# EAGLE design source_eagle (EAGLE 6.5.0)
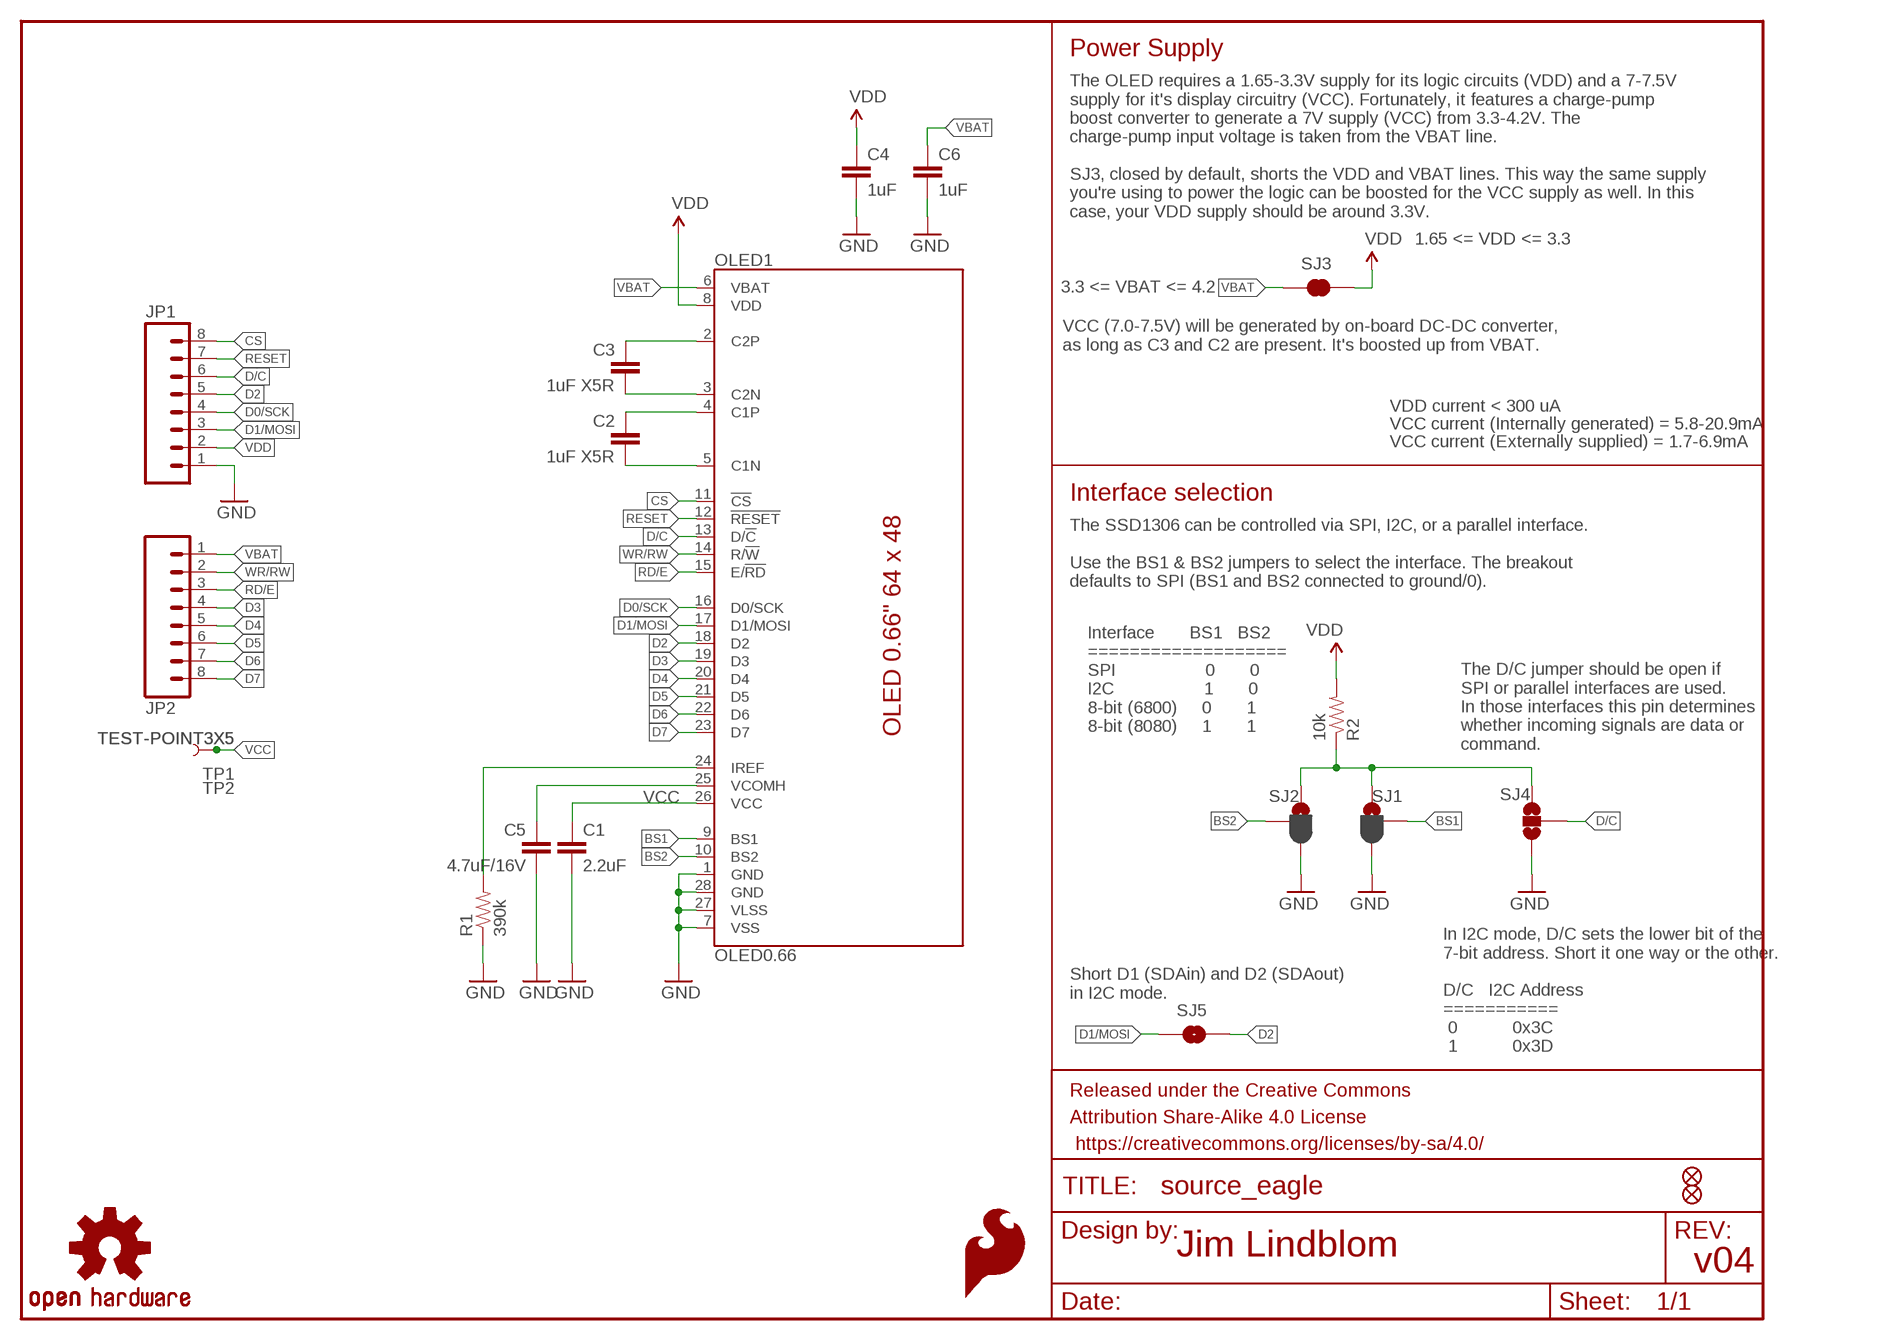
[diagram p0: schematic, sheet 1]

## Parts
C1  2.2uF  CAP0805  [0805]
C2  1uF X5R  CAP0805  [0805]
C3  1uF X5R  CAP0805  [0805]
C4  1uF  CAP0603-CAP  [0603-CAP]
C5  4.7uF/16V  CAP1206  [1206]
C6  1uF  CAP0603-CAP  [0603-CAP]
FID1  FIDUCIAL1X2  [FIDUCIAL-1X2]
FID2  FIDUCIAL1X2  [FIDUCIAL-1X2]
FRAME1  FRAME-LETTER  [CREATIVE_COMMONS]
JP1  M08  [1X08_PIN1_NO_SILK]
JP2  M08  [1X08_PIN1_NO_SILK]
LOGO3  OSHW-LOGOS  [OSHW-LOGO-S]
LOGO4  SFE_LOGO_FLAME.1_INCH  [SFE_LOGO_FLAME_.1]
OLED1  OLED0.66  [OLED-0.66-64X48]
R1  390k  RESISTOR0603-RES  [0603-RES]
R2  10k  RESISTOR0603-RES  [0603-RES]
SJ1  BS1  JUMPER-PAD-3-2OF3_NC_BY_PASTE  [PAD-JUMPER-3-2OF3_NC_BY_PASTE_YES_SILK_FULL_BOX]
SJ2  BS2  JUMPER-PAD-3-2OF3_NC_BY_PASTE  [PAD-JUMPER-3-2OF3_NC_BY_PASTE_YES_SILK_FULL_BOX]
SJ3  JUMPER-PAD-2-NC_BY_TRACENO_SILK  [PAD-JUMPER-2-NC_BY_TRACE_NO_SILK]
SJ4  JUMPER-PAD-3-NOTIGHT  [PAD-JUMPER-3-NO-TIGHT]
SJ5  JUMPER-PAD-2-NOYES_SILK  [PAD-JUMPER-2-NO_YES_SILK]
TP1  TEST-POINT3X5  [PAD.03X.05]
TP2  TEST-POINT3X5  [PAD.03X.05]

## Nets
BS1: OLED1.9(BS1) SJ1.2
BS2: OLED1.10(BS2) SJ2.2
C1N: C2.2 OLED1.5(C1N)
C1P: C2.1 OLED1.4(C1P)
C2N: C3.2 OLED1.3(C2N)
C2P: C3.1 OLED1.2(C2P)
CS: JP1.8 OLED1.11(!CS!)
D0/SCK: JP1.4 OLED1.16(D0/SCK)
D1/MOSI: JP1.3 OLED1.17(D1/MOSI) SJ5.1
D2: JP1.5 OLED1.18(D2) SJ5.2
D3: JP2.4 OLED1.19(D3)
D4: JP2.5 OLED1.20(D4)
D5: JP2.6 OLED1.21(D5)
D6: JP2.7 OLED1.22(D6)
D7: JP2.8 OLED1.23(D7)
D/C: JP1.6 OLED1.13(D/!C!) SJ4.2
GND: C1.2 C4.2 C5.2 C6.2 JP1.1 OLED1.1(GND) OLED1.7(VSS) OLED1.27(VLSS) OLED1.28(GND) R1.1 SJ1.3 SJ2.3 SJ4.3
IREF: OLED1.24(IREF) R1.2
RD/E: JP2.3 OLED1.15(E/!RD!)
RESET: JP1.7 OLED1.12(!RESET!)
VBAT: C6.1 JP2.1 OLED1.6(VBAT) SJ3.1
VCC: C1.1 OLED1.26(VCC) TP1.P$1 TP2.P$1
VCOMH: C5.1 OLED1.25(VCOMH)
VDD: C4.1 JP1.2 OLED1.8(VDD) R2.2 SJ3.2
VDD_PU: R2.1 SJ1.1 SJ2.1 SJ4.1
WR/RW: JP2.2 OLED1.14(R/!W!)

## Notes on the sheet
- Power Supply
- The OLED requires a 1.65-3.3V supply for its logic circuits (VDD) and a 7-7.5V
  supply for it's display circuitry (VCC). Fortunately, it features a charge-pump 
  boost converter to generate a 7V supply (VCC) from 3.3-4.2V. The 
  charge-pump input voltage is taken from the VBAT line.
  
  SJ3, closed by default, shorts the VDD and VBAT lines. This way the same supply 
  you're using to power the logic can be boosted for the VCC supply as well. In this 
  case, your VDD supply should be around 3.3V.
- 1.65 <= VDD <= 3.3
- 3.3 <= VBAT <= 4.2
- VCC (7.0-7.5V) will be generated by on-board DC-DC converter, 
  as long as C3 and C2 are present. It's boosted up from VBAT.
- VDD current < 300 uA
- VCC current (Internally generated) = 5.8-20.9mA
- VCC current (Externally supplied) = 1.7-6.9mA
- Interface selection
- The SSD1306 can be controlled via SPI, I2C, or a parallel interface.
  
  Use the BS1 & BS2 jumpers to select the interface. The breakout 
  defaults to SPI (BS1 and BS2 connected to ground/0).
- Interface       BS1   BS2
  ===================
  SPI                  0       0
  I2C                  1       0
  8-bit (6800)     0       1
  8-bit (8080)     1       1
- The D/C jumper should be open if
  SPI or parallel interfaces are used.
  In those interfaces this pin determines
  whether incoming signals are data or
  command.
- Short D1 (SDAin) and D2 (SDAout)
  in I2C mode.
- In I2C mode, D/C sets the lower bit of the 
  7-bit address. Short it one way or the other.
  
  D/C   I2C Address
  ===========
   0           0x3C
   1           0x3D
- Jim Lindblom
- v04

## Library data of the parts
C1-C6 = SparkFun-Passives:CAP: Capacitor Standard 0603 ceramic capacitor, and 0.1" leaded capacitor.
FID1 FID2 = SparkFun-Aesthetics:FIDUCIAL: Fiducial Alignment Points Various fiducial points for machine vision alignment.
FRAME1 = SparkFun-Aesthetics:FRAME-LETTER: Schematic Frame Standard 8.5x11 US Letter frame
JP1 JP2 = SparkFun-Connectors:M08: Header 8 Standard 8-pin 0.1" header. Use with straight break away headers (SKU : PRT-00116), right angle break away headers (PRT-00553), swiss pins (PRT-00743), machine pins (PRT-00117), and female headers (PRT-00115).
LOGO3 = SparkFun-Aesthetics:OSHW-LOGO: Open Source Hardware Logo This logo indicates the piece of hardware it is found on incorporates a OSHW license and/or adheres to the definition of open source hardware found here: http://freedomdefined.org/OSHW
LOGO4 = SparkFun-Aesthetics:SFE_LOGO_FLAME: SFE Logo, flame only This is the SparkFun flame logo. The logo on the schematic will always be the same size; the package variant is the height of the flame. Default layer for the logo on the board is tSilk.
OLED1 = microView-temp:OLED0.66
R1 R2 = SparkFun-Passives:RESISTOR: Resistor Basic schematic elements and footprints for 0603, 1206, and PTH resistors.
SJ1 SJ2 = SparkFun-Passives:JUMPER-PAD-3-2OF3_NC_BY_PASTE
SJ3 = SparkFun-Passives:JUMPER-PAD-2-NC_BY_TRACE
SJ4 = SparkFun-Passives:JUMPER-PAD-3-NO
SJ5 = SparkFun-Passives:JUMPER-PAD-2-NO
TP1 TP2 = SparkFun-Passives:TEST-POINT: Bare copper test points for troubleshooting or ICT

## Board
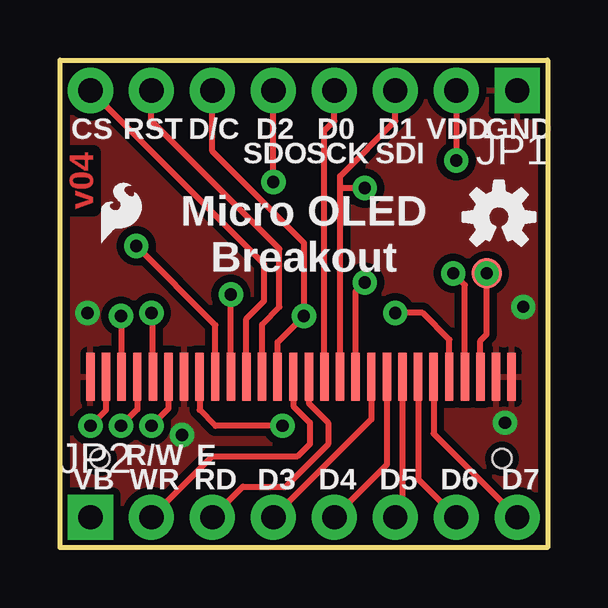
[diagram p1: board, top side]
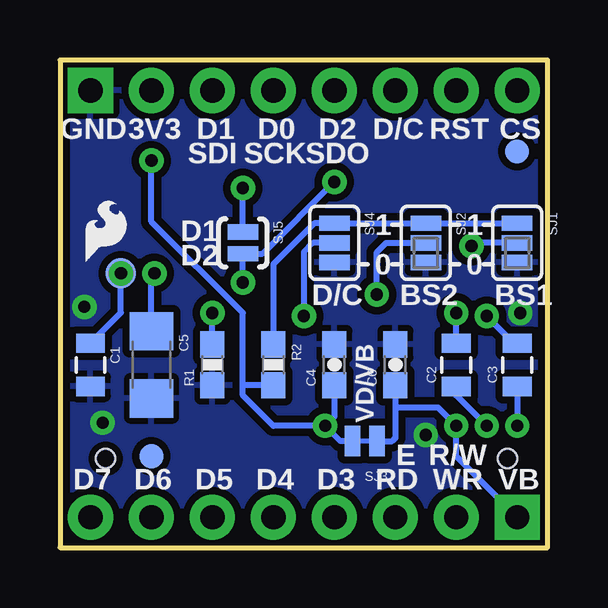
[diagram p2: board, bottom side, seen from below]

Size 20.32 x 20.32 mm. Coordinates in mm from the lower left corner, seen from the top.
Outline: 0,0 0,20.32 20.32,20.32 20.32,0 0,0
Copper layers (1*16): Top 0.035mm / dielectric 1.5mm / Bottom 0.035mm
Design rules "SparkFun-2-layer": minimum track width 7mil, minimum drill 15mil, track to track 8mil, track to pad 8mil, pad to pad 8mil, via to via 8mil, smd to smd 8mil, copper to edge 8mil, drill to drill 8mil, minimum pad ring 12mil, minimum via ring 10mil, stop-mask expansion 4mil, vias tented up to drill 20mil, thermal gap 10mil

### Footprints (pad centres in the part's own frame; a part is rotated, then mirrored left to right if it is on the bottom)
0805 = smd 0.8 x 1.2: 1 -0.9,0; 2 0.9,0
0603-CAP = smd 1.1 x 1: 1 -0.85,0; 2 0.85,0
1206 = smd 1.6 x 1.8: 1 -1.4,0; 2 1.4,0
FIDUCIAL-1X2 = smd 1 x 1: 1 0,0
1X08_PIN1_NO_SILK = drill 1.016 pad 1.88 square: 1 0,0 | drill 1.016 pad 1.88: 2 2.54,0; 3 5.08,0; 4 7.62,0; 5 10.16,0; 6 12.7,0; 7 15.24,0; 8 17.78,0
OLED-0.66-64X48 = smd 0.35 x 2: 1 0,0; 2 0.65,0; 3 1.3,0; 4 1.95,0; 5 2.6,0; 6 3.25,0; 7 3.9,0; 8 4.55,0; 9 5.2,0; 10 5.85,0; 11 6.5,0; 12 7.15,0; 13 7.8,0; 14 8.45,0; 15 9.1,0; 16 9.75,0; 17 10.4,0; 18 11.05,0; 19 11.7,0; 20 12.35,0; 21 13,0; 22 13.65,0; 23 14.3,0; 24 14.95,0; 25 15.6,0; 26 16.25,0; 27 16.9,0; 28 17.55,0 | hole 0.8: 17.15,-3.4; 0.4,-3.4
0603-RES = smd 1.1 x 1: 1 -0.85,0; 2 0.85,0
PAD-JUMPER-3-2OF3_NC_BY_PASTE_YES_SILK_FULL_BOX = smd 0.635 x 1.27: 1 -0.813,0; 2 0,0; 3 0.813,0
PAD-JUMPER-2-NC_BY_TRACE_NO_SILK = smd 0.635 x 1.27: 1 -0.508,0; 2 0.508,0
PAD-JUMPER-3-NO-TIGHT = smd 0.635 x 1.27: 1 -0.813,0; 2 0,0; 3 0.813,0
PAD-JUMPER-2-NO_YES_SILK = smd 0.635 x 1.27: 1 -0.45,0; 2 0.45,0
PAD.03X.05 = smd 1.27 x 1.27: P$1 0,0

### Placement (x,y rotation side)
C1  19.05,7.62 270 bottom
C2  3.81,7.62 90 bottom
C3  1.27,7.62 90 bottom
C4  8.89,7.62 90 bottom
C5  16.51,7.62 270 bottom
C6  6.35,7.62 90 bottom
FID1  16.51,3.81 0 bottom
FID2  1.27,16.51 0 bottom
FRAME1  not placed on the board
JP1  19.05,19.05 180 top
JP2  1.27,1.27 0 top
LOGO2  SFE_LOGO_FLAME.1_INCH  [SFE_LOGO_FLAME_.1]  1.4,12.32 0 top
LOGO3  18.29,13.78 0 top
LOGO4  19.56,11.56 0 bottom
OLED1  1.27,7.11 0 top
R1  13.97,7.62 90 bottom
R2  11.43,7.62 270 bottom
SJ1  1.27,12.7 270 bottom
SJ2  5.08,12.7 270 bottom
SJ3  7.62,4.45 180 bottom
SJ4  8.89,12.7 270 bottom
SJ5  12.7,12.7 270 bottom
TP1  17.78,11.43 0 bottom
TP2  17.78,11.43 0 top

### Tracks (layer width: path | path; a pad name or v marks a point on that pad's centre or on a via)
BS1  (via drill 0.51)
  Top 0.254: OLED1.9 6.47,9.28 v3.17,12.57
  Bottom 0.254: SJ1.2 3.05,12.7 v3.17,12.57
BS2  (via drill 0.51)
  Top 0.254: OLED1.10 v7.12,10.55
  Bottom 0.254: v7.12,10.55 7.12,12.31 6.73,12.7 SJ2.2
C1N  (via drill 0.51)
  Top 0.254: OLED1.5 3.87,9.72 v3.81,9.78
  Bottom 0.254: C2.2 v3.81,9.78
C1P  (via drill 0.51)
  Top 0.254: OLED1.4 3.22,5.76 v2.54,5.08
  Bottom 0.254: C2.1 3.81,6.35 v2.54,5.08
C2N  (via drill 0.51)
  Top 0.254: OLED1.3 2.57,9.62 v2.54,9.65
  Bottom 0.254: C3.2 1.41,8.52 v2.54,9.65
C2P  (via drill 0.51)
  Top 0.254: v1.27,5.08 1.92,5.73 OLED1.2
  Bottom 0.254: C3.1 v1.27,5.08
CS
  Top 0.254: OLED1.11 7.77,9.55 8.51,10.29 8.51,11.81 JP1.8
D0/SCK
  Top 0.254: OLED1.16 11.02,17.37 11.43,17.78 JP1.4
D1/MOSI  (via drill 0.51)
  Top 0.254: OLED1.17 11.67,14.99 | 11.67,14.99 11.67,15.48 13.97,17.78 JP1.3 | v12.7,14.99 11.67,14.99
  Bottom 0.254: SJ5.1 v12.7,14.99
D2  (via drill 0.51)
  Top 0.254: OLED1.18 12.32,10.67 v12.7,11.05 | v8.89,15.24 JP1.5
  Bottom 0.254: v12.7,11.05 SJ5.2 11.88,12.25 v8.89,15.24
D3
  Top 0.254: OLED1.19 12.97,5.35 JP2.4
D4
  Top 0.254: OLED1.20 13.62,3.46 JP2.5
D5
  Top 0.254: OLED1.21 14.27,1.57 JP2.6
D6
  Top 0.254: OLED1.22 14.92,2.86 JP2.7
D7
  Top 0.254: OLED1.23 15.57,4.75 JP2.8
D/C  (via drill 0.51)
  Top 0.254: OLED1.13 9.07,8.56 v10.16,9.65 10.16,12.7 6.35,16.51 JP1.6
  Bottom 0.254: SJ4.2 9.78,12.7 10.16,12.32 v10.16,9.65
GND  (via drill 0.51)
  other vias: 5.08,4.7 18.54,5.21 1.14,9.78 19.3,10.03
  pour Top (isolate 0.305): 0,0 0,20.32 20.32,20.32 20.32,0
  pour Bottom (isolate 0.305): 0,0 0,20.32 20.32,20.32 20.32,0
IREF  (via drill 0.51)
  Top 0.254: OLED1.24 16.22,8.67 15.11,9.78 v13.97,9.78
  Bottom 0.254: R1.2 v13.97,9.78
RD/E
  Top 0.254: OLED1.15 10.37,6.01 11.18,5.21 11.18,4.32 9.4,2.54 7.62,2.54 JP2.3
RESET
  Top 0.254: OLED1.12 8.42,9.31 9.14,10.03 9.14,12.45 3.81,17.78 JP1.7
VBAT  (via drill 0.51)
  Top 0.254: OLED1.6 4.52,5.79 v3.81,5.08
  Bottom 0.254: JP2.1 3.81,3.81 v3.81,5.08 4.57,5.84 6.35,5.84 | C6.1 6.35,5.84 | 6.35,5.84 6.35,4.57 6.48,4.45 SJ3.1
VCC  (via drill 0.51)
  Top 0.254: OLED1.26 17.52,8.63 17.78,8.89 TP2.P$1
  Bottom 0.254: C1.1 17.78,9.79 TP2.P$1
  other vias: 17.78,11.43
VCOMH  (via drill 0.51)
  Top 0.254: OLED1.25 16.87,10.94 v16.38,11.43
  Bottom 0.254: C5.1 16.51,11.3 v16.38,11.43
VDD  (via drill 0.51)
  Top 0.254: JP1.2 v16.51,16.13 | v9.27,5.08 6.48,5.08 5.82,5.74 OLED1.8
  Bottom 0.254: 12.7,6.73 12.7,6.35 11.43,5.08 v9.27,5.08 | 12.7,6.73 12.7,9.78 16.51,13.59 v16.51,16.13 | C4.1 8.89,5.46 v9.27,5.08 | R2.2 12.66,6.77 12.7,6.73 | SJ3.2 8.64,4.45 v9.27,5.08
VDD_PU
  Bottom 0.254: R2.1 11.43,11.81 9.73,13.51 SJ4.1 SJ2.1 SJ1.1
WR/RW
  Top 0.254: JP2.2 6.35,3.81 9.91,3.81 10.41,4.32 10.41,5.21 9.72,5.9 OLED1.14

### Text on the board
Top: v04
tPlace: CS | RST | D/C | D2 | D0 | D1 | VDD | GND | SDO | SCK | SDI | Micro OLED / Breakout | R/W | E | VB | WR | RD | D3 | D4 | D5 | D6 | D7
bPlace: CS | RST | D/C | D2 | D0 | D1 | 3V3 | GND | SDO | SCK | SDI | 1 | 1 | D1 | 0 | 0 | D2 | BS1 | BS2 | D/C | VD/VB | R/W | E | VB | WR | RD | D3 | D4 | D5 | D6 | D7
tDocu: Jim Lindblom